# Altium project controller.PrjPCB
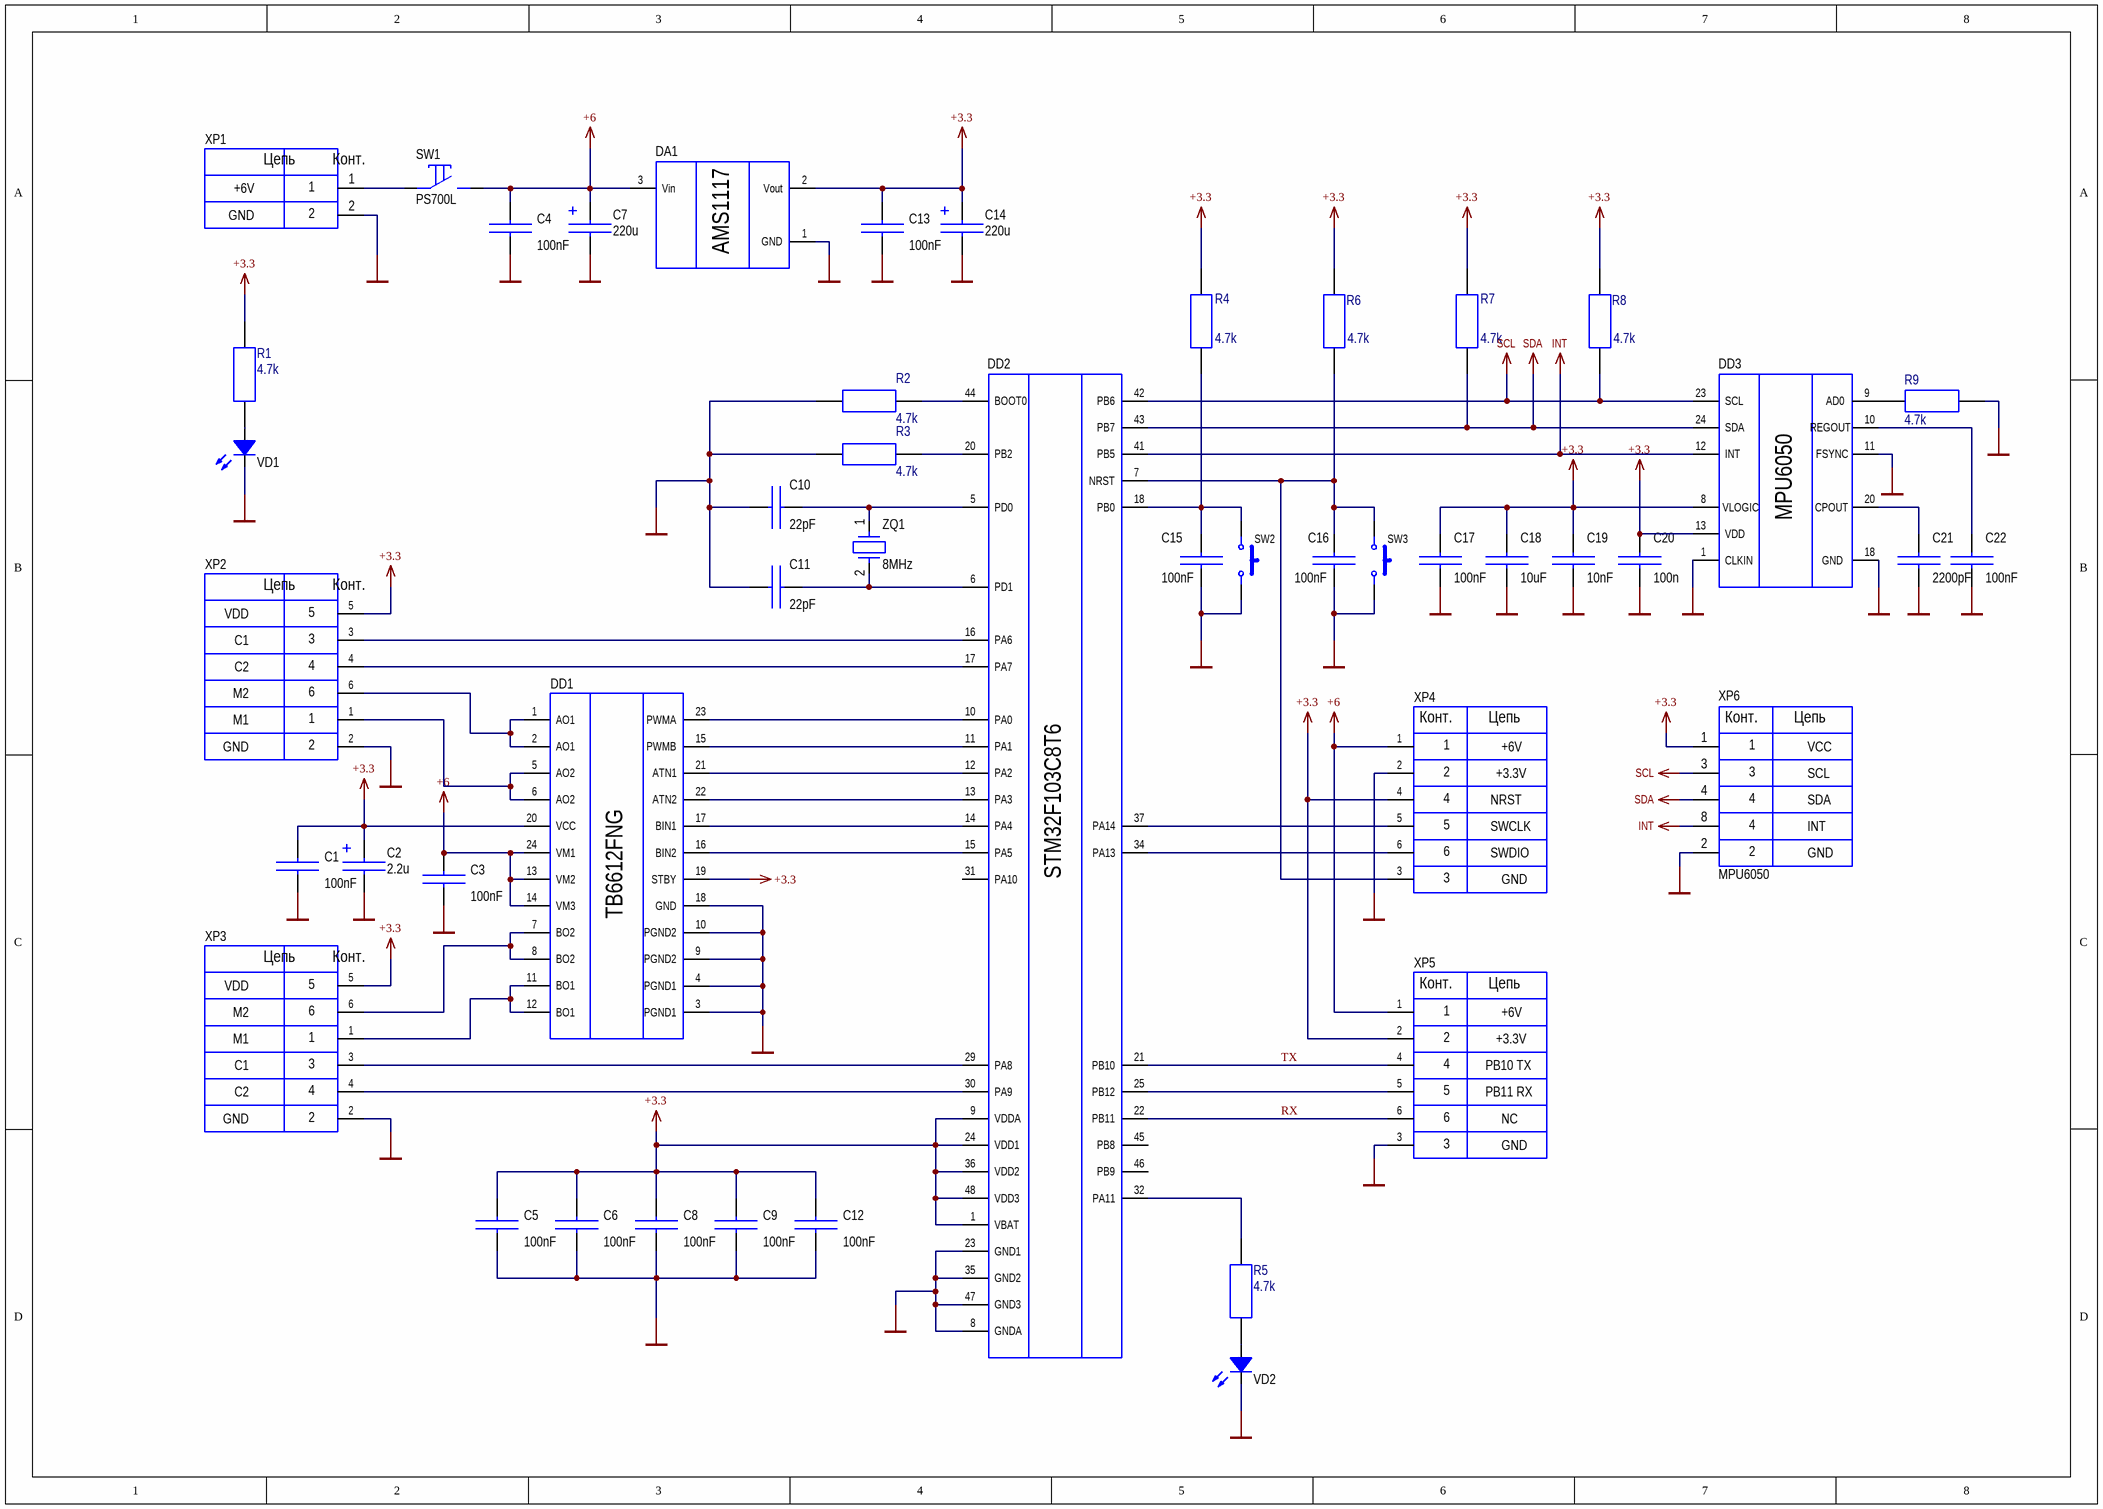
[diagram p0: controller.SchDoc]
1 sheet, 47 parts. Net scope: global (net labels, ports and power ports of the same name join across sheets).
Board file: controller.PcbDoc

## Sheet controller.SchDoc
size A3

### Parts
C1  value 100nF  [CAP0805]  (hidden comment: CAPASITOR)
C2  2.2u  [CAPMP2012X150USR]
C3  value 100nF  [CAP0805]  (hidden comment: CAPASITOR)
C4  value 100nF  [CAP0805]  (hidden comment: CAPASITOR)
C5  value 100nF  [CAP0805]  (hidden comment: CAPASITOR)
C6  value 100nF  [CAP0805]  (hidden comment: CAPASITOR)
C7  220u  [CAP_ELEC_SIZE_E]
C8  value 100nF  [CAP0805]  (hidden comment: CAPASITOR)
C9  value 100nF  [CAP0805]  (hidden comment: CAPASITOR)
C10  value 22pF  [CAP0805]  (hidden comment: CAPASITOR)
C11  value 22pF  [CAP0805]  (hidden comment: CAPASITOR)
C12  value 100nF  [CAP0805]  (hidden comment: CAPASITOR)
C13  value 100nF  [CAP0805]  (hidden comment: CAPASITOR)
C14  220u  [CAP_ELEC_SIZE_E]
C15  value 100nF  [CAP0805]  (hidden comment: CAPASITOR)
C16  value 100nF  [CAP0805]  (hidden comment: CAPASITOR)
C17  value 100nF  [CAP0805]  (hidden comment: CAPASITOR)
C18  value 10uF  [CAP0805]  (hidden comment: CAPASITOR)
C19  value 10nF  [CAP0805]  (hidden comment: CAPASITOR)
C20  value 100n  [CAP0805]  (hidden comment: CAPASITOR)
C21  value 2200pF  [CAP0805]  (hidden comment: CAPASITOR)
C22  value 100nF  [CAP0805]  (hidden comment: CAPASITOR)
DA1  AMS1117  [SOT-223]
DD1  TB6612FNG  [SSOP24]
DD2  STM32F103C8T6  [LQFP48_N]
DD3  MPU6050  [QFN24]
R1  value 4.7k  [RES0805]  (hidden comment: RESISTOR)
R2  value 4.7k  [RES0805]  (hidden comment: RESISTOR)
R3  value 4.7k  [RES0805]  (hidden comment: RESISTOR)
R4  value 4.7k  [RES0805]  (hidden comment: RESISTOR)
R5  value 4.7k  [RES0805]  (hidden comment: RESISTOR)
R6  value 4.7k  [RES0805]  (hidden comment: RESISTOR)
R7  value 4.7k  [RES0805]  (hidden comment: RESISTOR)
R8  value 4.7k  [RES0805]  (hidden comment: RESISTOR)
R9  value 4.7k  [RES0805]  (hidden comment: RESISTOR)
SW1  PS700L  [PS700L]
SW2  SWITCH  [KLS76x6x4.3]  (value not drawn)
SW3  SWITCH  [KLS76x6x4.3]  (value not drawn)
VD1  RED  [LED0805]  (value not drawn)
VD2  RED  [LED0805]  (value not drawn)
XP1  PH2.0-2P  [PH2.0-2P]  (value not drawn)
XP2  PH2.0-6P  [PH2.0-6P]  (value not drawn)
XP3  PH2.0-6P  [PH2.0-6P]  (value not drawn)
XP4  PLS-2-3  [PBD2-3]  (value not drawn)
XP5  PLS-2-3_1  [PBD2-3]  (value not drawn)
XP6  MPU6050  [PBD2-16]
ZQ1  8MHz  [HC-49SM]

### Nets
+3.3: C1.2 C2.1 C5.2 C6.2 C8.2 C9.2 C12.2 C13.2 C14.1 C17.2 C18.2 C19.2 C20.2 DA1.2(Vout) DD1.19(STBY) DD1.20(VCC) DD2.1(VBAT) DD2.9(VDDA) DD2.24(VDD1) DD2.36(VDD2) DD2.48(VDD3) DD3.8(VLOGIC) DD3.13(VDD) R1.1 R4.2 R6.2 R7.2 R8.2 XP2.5(VDD) XP3.5(VDD) XP4.4(NRST) XP5.2(+3.3V) XP6.1(VCC)
+6: C3.2 C4.2 C7.1 DA1.3(Vin) DD1.13(VM2) DD1.14(VM3) DD1.24(VM1) SW1.3 XP4.1(+6V) XP5.1(+6V)
GND: C1.1 C2.2 C3.1 C4.1 C5.1 C6.1 C7.2 C8.1 C9.1 C10.2 C11.2 C12.1 C13.1 C14.2 C15.1 C16.1 C17.1 C18.1 C19.1 C20.1 C21.1 C22.1 DA1.1(GND) DD1.3(PGND1) DD1.4(PGND1) DD1.9(PGND2) DD1.10(PGND2) DD1.18(GND) DD2.8(GNDA) DD2.23(GND1) DD2.35(GND2) DD2.47(GND3) DD3.1(CLKIN) DD3.11(FSYNC) DD3.18(GND) R2.2 R3.2 R9.1 SW2.2 SW3.2 VD1.2(K) VD2.2(K) XP1.2(GND) XP2.2(GND) XP3.2(GND) XP4.2(+3.3V) XP5.3(GND) XP6.2(GND)
INT: DD2.41(PB5) DD3.12(INT) XP6.8(INT)
SCL: DD2.42(PB6) DD3.23(SCL) R8.1 XP6.3(SCL)
SDA: DD2.43(PB7) DD3.24(SDA) R7.1 XP6.4(SDA)
RX: DD2.22(PB11) XP5.6(NC)
TX: DD2.21(PB10) XP5.4(PB10_TX)
NetC10_1: C10.1 DD2.5(PD0) ZQ1.1
NetC11_1: C11.1 DD2.6(PD1) ZQ1.2
NetC15_2: C15.2 DD2.18(PB0) R4.1 SW2.1
NetC16_2: C16.2 DD2.7(NRST) R6.1 SW3.1 XP4.3(GND)
NetC21_2: C21.2 DD3.20(CPOUT)
NetC22_2: C22.2 DD3.10(REGOUT)
NetDD1_1: DD1.1(AO1) DD1.2(AO1) XP2.6(M2)
NetDD1_5: DD1.5(AO2) DD1.6(AO2) XP2.1(M1)
NetDD1_7: DD1.7(BO2) DD1.8(BO2) XP3.6(M2)
NetDD1_11: DD1.11(BO1) DD1.12(BO1) XP3.1(M1)
NetDD1_15: DD1.15(PWMB) DD2.11(PA1)
NetDD1_16: DD1.16(BIN2) DD2.15(PA5)
NetDD1_17: DD1.17(BIN1) DD2.14(PA4)
NetDD1_21: DD1.21(ATN1) DD2.12(PA2)
NetDD1_22: DD1.22(ATN2) DD2.13(PA3)
NetDD1_23: DD1.23(PWMA) DD2.10(PA0)
NetDD2_16: DD2.16(PA6) XP2.3(C1)
NetDD2_17: DD2.17(PA7) XP2.4(C2)
NetDD2_20: DD2.20(PB2) R3.1
NetDD2_25: DD2.25(PB12) XP5.5(PB11_RX)
NetDD2_29: DD2.29(PA8) XP3.3(C1)
NetDD2_30: DD2.30(PA9) XP3.4(C2)
NetDD2_32: DD2.32(PA11) R5.1
NetDD2_34: DD2.34(PA13) XP4.6(SWDIO)
NetDD2_37: DD2.37(PA14) XP4.5(SWCLK)
NetDD2_44: DD2.44(BOOT0) R2.1
NetDD3_9: DD3.9(AD0) R9.2
NetR1_2: R1.2 VD1.1(A)
NetR5_2: R5.2 VD2.1(A)
NetSW1_2: SW1.2 XP1.1(+6V)

Not connected (* = marked no-connect by the designer): DD2 31(PA10) 45(PB8) 46(PB9)

### Notes on the sheet
- (in symbol CAPASITOR_POLAR) +
- (in symbol PBD-1-8) Конт.; Цепь
- (in symbol PH2.0-2P) Цепь; Конт.
- (in symbol PH2.0-6P) Цепь; Конт.
- (in symbol PLS-2-3) Конт.; Цепь
- (in symbol PLS-2-3_1) Конт.; Цепь

### Library data of the parts
C1 C3-C6 C8-C13 C15-C22 = CAPASITOR: CAP
C2 C7 C14 = CAPASITOR_POLAR: CAP
DA1 = AMS1117-3.3
DD1 = DRIVER-TB6612FNG-O/C8/EL(SSOP24)(ESKD): Stepping Motor Driver Ic Unipolor Copper Wire 8; MP: TB6612FNG_O,C,8,EL; MF: Toshiba; Price: None; SnapEDA_Link: https://www.snapeda.com/parts/TB6612FNG%28O%2CC%2C8%2CEL/Toshiba/view-part/?ref=snap; Availability: Unavailable; Package: SSOP-24 Toshiba; Value: *
DD2 = STM32F103C8T6: A/D Converter: 2x12-bit (10 Channel); Core: ARM Cortex-M3; FLASH Size (Prog) (kB): 64; I/Os (High Current): 37; Internal RAM Size (kB): 20; Operating Frequency(F) (Processor speed) (MHz): 72; Packing: Tray; Supply Voltage(Vcc) min (V): 2; DatasheetVersion: Rev. 16; PackageVersion: Rev. 6, 06/2013; PackageReference: LQFP48; PackageDescription: 48-Pin Low Profile Quad Flat Package, 7 x 7 mm Body, 0.5 mm Pitch; Supplier 1: Digi-Key; Supplier Part Number 1: 497-6063-ND; Supplier 2: Farnell; Supplier Part Number 2: 1447637; Supplier 3: Newark; Supplier Part Number 3: 59M2182; Supplier 4: Newark; Supplier Part Number 4: 57P1222; Supplier 5: Mouser; Supplier Part Number 5: 511-STM32F103C8T6; Mounting Technology: Surface Mount; PartNumber: STM32F103C8T6; ComponentLink1Description: Manufacturer URL; ComponentLink1URL: http://www.st.com/web/en/home.html; ComponentLink2Description: Datasheet; ComponentLink2URL: http://www.st.com/st-web-ui/static/active/en/resource/technical/document/datasheet/CD00161566.pdf; ComponentLink3Description: Package Specification; ComponentLink3URL: http://www.st.com/st-web-ui/static/active/en/resource/technical/document/datasheet/DM00058181.pdf
DD3 = MPU6050(ESKD)
R1-R9 = RESISTOR: *
VD1 VD2 = diode_led
XP6 = PBD-1-8
ZQ1 = HC-49
SW1 = PS700L: ComponentLink1Description: datasheet; ComponentLink1URL: https://static.chipdip.ru/lib/054/DOC000054735.pdf
SW2 SW3 = SWITCH: ComponentLink1Description: AliExpress; ComponentLink1URL: https://ru.aliexpress.com/item/10PCS-4-4-1-6mm-4x4x1-6H-SMD-push-button-switch-microswitch-Tact-Switch/32731081870.html?spm=a2g0s.9042311.0.0.250233edGDnBBV
XP1 = PH2.0-2P: ComponentLink1Description: PH2.0-6P; ComponentLink1URL: https://ru.aliexpress.com/item/PH2-0-Pin-2-0/32959003108.html?spm=a2g0s.13010208.99999999.267.6b9d3c00Fzf6qQ
XP2 XP3 = PH2.0-6P: ComponentLink1Description: PH2.0-6P; ComponentLink1URL: https://ru.aliexpress.com/item/PH2-0-Pin-2-0/32959003108.html?spm=a2g0s.13010208.99999999.267.6b9d3c00Fzf6qQ
XP4 = PLS-2-3: ComponentLink1Description: PH2.0-6P; ComponentLink1URL: https://ru.aliexpress.com/item/PH2-0-Pin-2-0/32959003108.html?spm=a2g0s.13010208.99999999.267.6b9d3c00Fzf6qQ
XP5 = PLS-2-3_1: ComponentLink1Description: PH2.0-6P; ComponentLink1URL: https://ru.aliexpress.com/item/PH2-0-Pin-2-0/32959003108.html?spm=a2g0s.13010208.99999999.267.6b9d3c00Fzf6qQ